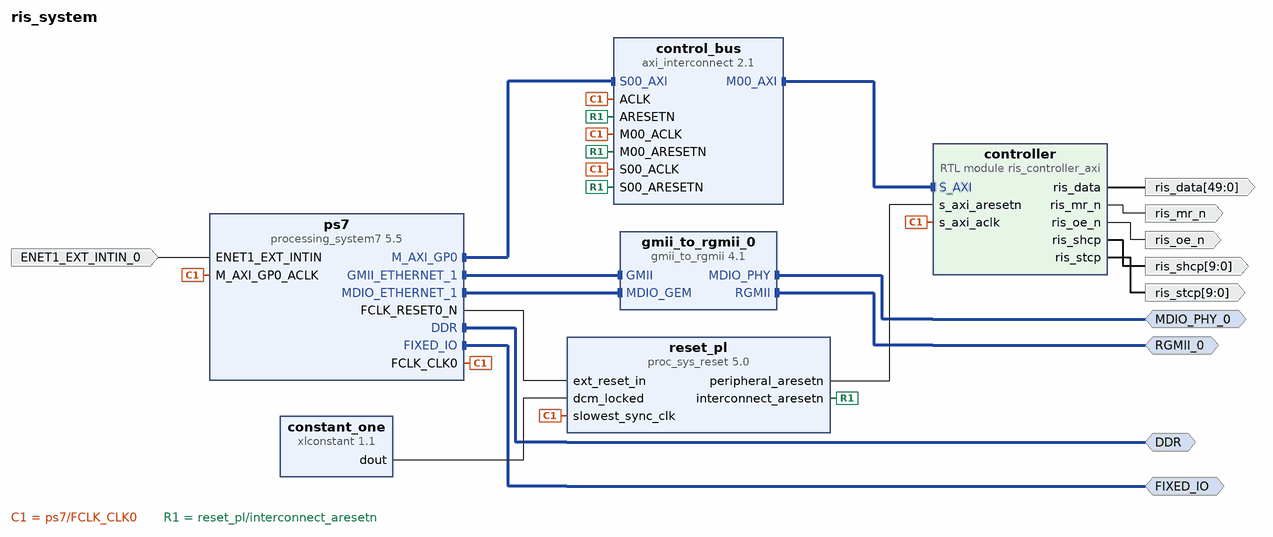
[diagram p0: block diagram of the top level]
# Vivado block design ris_system, xc7z045ffg900-2, Vivado 2022.2
create_bd_design ris_system

create_bd_intf_port -mode Master -vlnv xilinx.com:interface:ddrx_rtl:1.0 DDR
create_bd_intf_port -mode Master -vlnv xilinx.com:display_processing_system7:fixedio_rtl:1.0 FIXED_IO
create_bd_intf_port -mode Master -vlnv xilinx.com:interface:mdio_rtl:1.0 MDIO_PHY_0
create_bd_intf_port -mode Master -vlnv xilinx.com:interface:rgmii_rtl:1.0 RGMII_0
create_bd_port -dir O -from 49 -to 0 ris_data
create_bd_port -dir O -from 9 -to 0 ris_shcp
create_bd_port -dir O -from 9 -to 0 ris_stcp
create_bd_port -dir O ris_mr_n
create_bd_port -dir O ris_oe_n
create_bd_port -dir I -type intr ENET1_EXT_INTIN_0

create_bd_cell -type ip -vlnv xilinx.com:ip:processing_system7:5.5 ps7
set_property -dict [list \
  CONFIG.PCW_APU_PERIPHERAL_FREQMHZ 667.000000 \
  CONFIG.PCW_CPU_CPU_6X4X_MAX_RANGE 800 \
  CONFIG.PCW_DUAL_PARALLEL_QSPI_DATA_MODE x8 \
  CONFIG.PCW_ENET0_ENET0_IO {MIO 16 .. 27} \
  CONFIG.PCW_ENET0_GRP_MDIO_ENABLE 1 \
  CONFIG.PCW_ENET0_GRP_MDIO_IO {MIO 52 .. 53} \
  CONFIG.PCW_ENET0_PERIPHERAL_ENABLE 1 \
  CONFIG.PCW_ENET0_PERIPHERAL_FREQMHZ {100 Mbps} \
  CONFIG.PCW_ENET0_RESET_ENABLE 1 \
  CONFIG.PCW_ENET0_RESET_IO {MIO 47} \
  CONFIG.PCW_ENET1_ENET1_IO EMIO \
  CONFIG.PCW_ENET1_GRP_MDIO_ENABLE 1 \
  CONFIG.PCW_ENET1_GRP_MDIO_IO EMIO \
  CONFIG.PCW_ENET1_PERIPHERAL_ENABLE 1 \
  CONFIG.PCW_ENET_RESET_ENABLE 1 \
  CONFIG.PCW_ENET_RESET_SELECT {Share reset pin} \
  CONFIG.PCW_FPGA0_PERIPHERAL_FREQMHZ 100 \
  CONFIG.PCW_FPGA1_PERIPHERAL_FREQMHZ 50 \
  CONFIG.PCW_GPIO_MIO_GPIO_ENABLE 1 \
  CONFIG.PCW_GPIO_MIO_GPIO_IO MIO \
  CONFIG.PCW_I2C_RESET_ENABLE 0 \
  CONFIG.PCW_PERIPHERAL_BOARD_PRESET part0 \
  CONFIG.PCW_PRESET_BANK0_VOLTAGE {LVCMOS 1.8V} \
  CONFIG.PCW_PRESET_BANK1_VOLTAGE {LVCMOS 1.8V} \
  CONFIG.PCW_QSPI_GRP_FBCLK_ENABLE 1 \
  CONFIG.PCW_QSPI_GRP_FBCLK_IO {MIO 8} \
  CONFIG.PCW_QSPI_GRP_IO1_ENABLE 1 \
  CONFIG.PCW_QSPI_GRP_IO1_IO {MIO 0 9 .. 13} \
  CONFIG.PCW_QSPI_GRP_SINGLE_SS_ENABLE 0 \
  CONFIG.PCW_QSPI_INTERNAL_HIGHADDRESS 0xFDFFFFFF \
  CONFIG.PCW_QSPI_PERIPHERAL_ENABLE 1 \
  CONFIG.PCW_QSPI_QSPI_IO {MIO 1 .. 6} \
  CONFIG.PCW_SD0_PERIPHERAL_ENABLE 0 \
  CONFIG.PCW_UART1_PERIPHERAL_ENABLE 1 \
  CONFIG.PCW_UART1_UART1_IO {MIO 48 .. 49} \
  CONFIG.PCW_UART_PERIPHERAL_FREQMHZ 100 \
  CONFIG.PCW_UIPARAM_DDR_FREQ_MHZ 533.333313 \
  CONFIG.PCW_UIPARAM_DDR_PARTNO Custom \
  CONFIG.PCW_USB0_PERIPHERAL_ENABLE 0 \
  CONFIG.PCW_USB_RESET_ENABLE 1 \
] [get_bd_cells ps7]
# 504 more settings of ps7 are not shown: defaults, MIO pin electricals, DDR timing, and values the tool derives
create_bd_cell -type ip -vlnv xilinx.com:ip:proc_sys_reset:5.0 reset_pl
create_bd_cell -type ip -vlnv xilinx.com:ip:xlconstant:1.1 constant_one
set_property -dict {CONFIG.CONST_VAL 1 CONFIG.CONST_WIDTH 1} [get_bd_cells constant_one]
create_bd_cell -type ip -vlnv xilinx.com:ip:axi_interconnect:2.1 control_bus
set_property -dict {CONFIG.NUM_MI 1} [get_bd_cells control_bus]
create_bd_cell -type module -reference ris_controller_axi controller
set_property -dict {CONFIG.FAST_TOGGLE_ENABLE 1 CONFIG.FRAME_SLOTS 16 CONFIG.ID_WIDTH 12} [get_bd_cells controller]
create_bd_cell -type ip -vlnv xilinx.com:ip:gmii_to_rgmii:4.1 gmii_to_rgmii_0

# ---- connections ----

connect_bd_intf_net [get_bd_intf_pins control_bus/M00_AXI] [get_bd_intf_pins controller/S_AXI]
connect_bd_intf_net [get_bd_intf_ports MDIO_PHY_0] [get_bd_intf_pins gmii_to_rgmii_0/MDIO_PHY]
connect_bd_intf_net [get_bd_intf_ports RGMII_0] [get_bd_intf_pins gmii_to_rgmii_0/RGMII]
connect_bd_intf_net [get_bd_intf_ports DDR] [get_bd_intf_pins ps7/DDR]
connect_bd_intf_net [get_bd_intf_ports FIXED_IO] [get_bd_intf_pins ps7/FIXED_IO]
connect_bd_intf_net [get_bd_intf_pins ps7/GMII_ETHERNET_1] [get_bd_intf_pins gmii_to_rgmii_0/GMII]
connect_bd_intf_net [get_bd_intf_pins ps7/MDIO_ETHERNET_1] [get_bd_intf_pins gmii_to_rgmii_0/MDIO_GEM]
connect_bd_intf_net [get_bd_intf_pins ps7/M_AXI_GP0] [get_bd_intf_pins control_bus/S00_AXI]
connect_bd_net -net ENET1_EXT_INTIN_0_1 [get_bd_ports ENET1_EXT_INTIN_0] [get_bd_pins ps7/ENET1_EXT_INTIN]
connect_bd_net [get_bd_pins constant_one/dout] [get_bd_pins reset_pl/dcm_locked]
connect_bd_net [get_bd_pins controller/ris_data] [get_bd_ports ris_data]
connect_bd_net [get_bd_pins controller/ris_mr_n] [get_bd_ports ris_mr_n]
connect_bd_net [get_bd_pins controller/ris_oe_n] [get_bd_ports ris_oe_n]
connect_bd_net [get_bd_pins controller/ris_shcp] [get_bd_ports ris_shcp]
connect_bd_net [get_bd_pins controller/ris_stcp] [get_bd_ports ris_stcp]
connect_bd_net [get_bd_pins ps7/FCLK_CLK0] \
  [get_bd_pins ps7/M_AXI_GP0_ACLK] [get_bd_pins reset_pl/slowest_sync_clk] [get_bd_pins control_bus/ACLK] \
  [get_bd_pins control_bus/S00_ACLK] [get_bd_pins control_bus/M00_ACLK] [get_bd_pins controller/s_axi_aclk]
connect_bd_net [get_bd_pins ps7/FCLK_RESET0_N] [get_bd_pins reset_pl/ext_reset_in]
connect_bd_net [get_bd_pins reset_pl/interconnect_aresetn] \
  [get_bd_pins control_bus/ARESETN] [get_bd_pins control_bus/S00_ARESETN] [get_bd_pins control_bus/M00_ARESETN]
connect_bd_net [get_bd_pins reset_pl/peripheral_aresetn] [get_bd_pins controller/s_axi_aresetn]

# ---- address map ----
assign_bd_address -offset 0x41200000 -range 64K -target_address_space [get_bd_addr_spaces ps7/Data] [get_bd_addr_segs controller/S_AXI/reg0]

validate_bd_design
save_bd_design
